# Altium schematic sheet LevelShifter_BSS138.SchDoc
size A; SheetNumber: 15; SheetTotal: 15
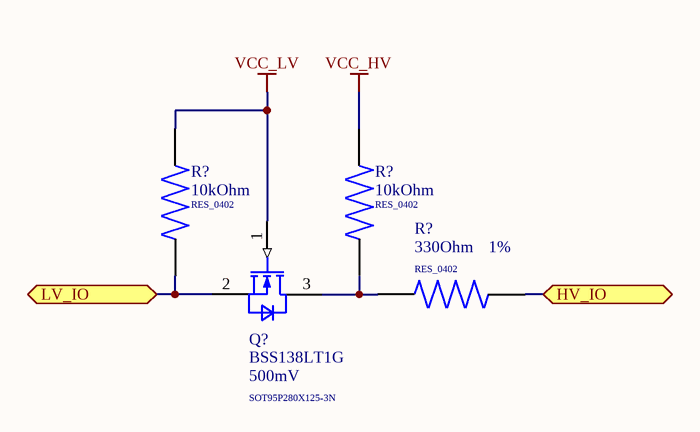
[diagram p0: LevelShifter_BSS138.SchDoc]

## Parts
(Parts that share a designator on the sheet are numbered #1, #2 ... from top to bottom, then left to right.)
Q?  SOT95P280X125-3N  Vgs(th): 500mV  MPN: BSS138LT1G  [SOT95P280X125-3N]
R?#1  RES_0402  value 10kOhm  [RES_0402]
R?#2  RES_0402  value 10kOhm  [RES_0402]
R?#3  RES_0402  value 330Ohm  Tolerance: 1%  [RES_0402]

## Ports
HV_IO (bidir), LV_IO (bidir)

## Nets
VCC_HV: R?#2.1
VCC_LV: Q?.1(GATE) R?#1.1
HV_IO: R?#3.1 ; port HV_IO
LV_IO: Q?.2(SOURCE) R?#1.2 ; port LV_IO
NetQ?_3: Q?.3(DRAIN) R?#2.2 R?#3.2

## Library data of the parts
Q? = NMOS_GSD: GENERIC N-MOSFET 1=G, 2=S, 3=D; Channel Type: N-Channel; LCSC Part Number: C82045; Vds (Max): *; Id (Max): *; MF: *; Rds(on) (Max): *
R?#1 R?#2 = RES: GENERIC RES; Tolerance: 1%; Power Rating: *; MPN: *; Rated Voltage: *; Temperature Coefficient: *; LCSC Part Number: C60490
R?#3 = RES: GENERIC RES; MPN: RC0402FR-07330RL; Power Rating: *; Rated Voltage: *; Temperature Coefficient: *; LCSC Part Number: C105875